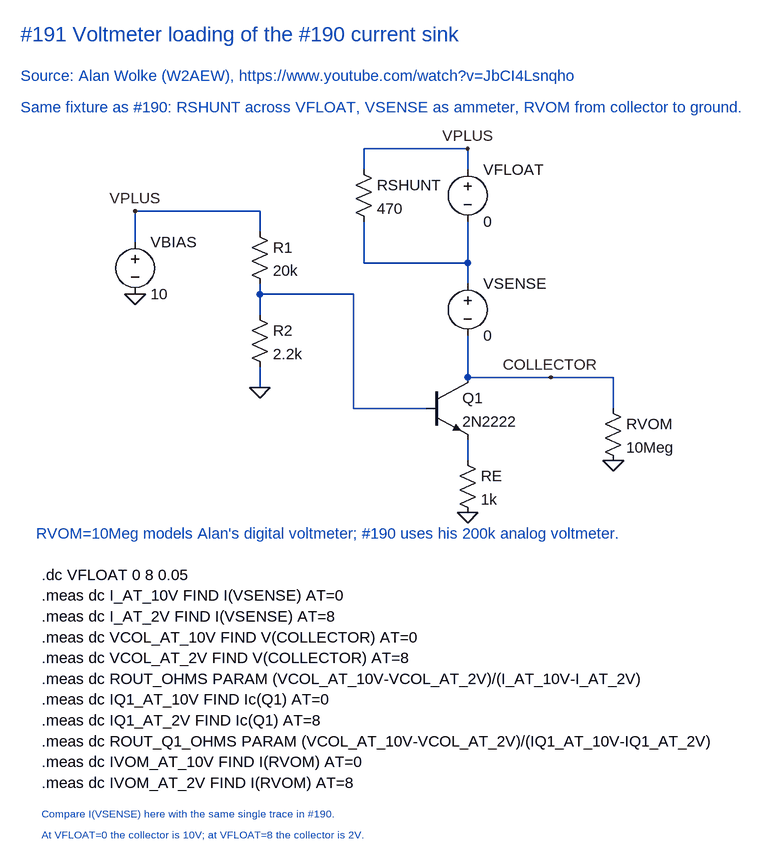
[diagram p0: schematic Current-source voltmeter loading.asc]
Current-source voltmeter loading.asc, the LTspice schematic file:
Version 4.1
SHEET 1 2208 1536
WIRE 736 -96 576 -96
WIRE 576 -64 576 -96
WIRE 736 -64 736 -96
WIRE 416 0 224 0
WIRE 416 32 416 0
WIRE 224 48 224 0
WIRE 576 80 576 16
WIRE 736 80 736 16
WIRE 736 80 576 80
WIRE 736 112 736 80
WIRE 416 128 416 112
WIRE 560 128 416 128
WIRE 416 160 416 128
WIRE 736 256 736 192
WIRE 864 256 736 256
WIRE 960 256 864 256
WIRE 416 272 416 240
WIRE 560 304 560 128
WIRE 672 304 560 304
WIRE 960 304 960 256
WIRE 736 384 736 352
FLAG 224 128 0
FLAG 416 272 0
FLAG 736 464 0
FLAG 960 384 0
FLAG 224 0 VPLUS
FLAG 736 -96 VPLUS
FLAG 864 256 COLLECTOR
SYMBOL voltage 224 32 R0
SYMATTR InstName VBIAS
SYMATTR Value 10
SYMBOL voltage 736 -80 R0
SYMATTR InstName VFLOAT
SYMATTR Value 0
SYMBOL res 400 16 R0
SYMATTR InstName R1
SYMATTR Value 20k
SYMBOL res 400 144 R0
SYMATTR InstName R2
SYMATTR Value 2.2k
SYMBOL res 560 -80 R0
SYMATTR InstName RSHUNT
SYMATTR Value 470
SYMBOL voltage 736 96 R0
SYMATTR InstName VSENSE
SYMATTR Value 0
SYMBOL npn 672 256 R0
SYMATTR InstName Q1
SYMATTR Value 2N2222
SYMBOL res 720 368 R0
SYMATTR InstName RE
SYMATTR Value 1k
SYMBOL res 944 288 R0
SYMATTR InstName RVOM
SYMATTR Value 10Meg
TEXT 48 -272 Left 3 ;#191 Voltmeter loading of the #190 current sink
TEXT 48 -208 Left 2 ;Source: Alan Wolke (W2AEW), https://www.youtube.com/watch?v=JbCI4Lsnqho
TEXT 48 -160 Left 2 ;Same fixture as #190: RSHUNT across VFLOAT, VSENSE as ammeter, RVOM from collector to ground.
TEXT 72 496 Left 2 ;RVOM=10Meg models Alan's digital voltmeter; #190 uses his 200k analog voltmeter.
TEXT 80 560 Left 2 !.dc VFLOAT 0 8 0.05
TEXT 80 592 Left 2 !.meas dc I_AT_10V FIND I(VSENSE) AT=0
TEXT 80 624 Left 2 !.meas dc I_AT_2V FIND I(VSENSE) AT=8
TEXT 80 656 Left 2 !.meas dc VCOL_AT_10V FIND V(COLLECTOR) AT=0
TEXT 80 688 Left 2 !.meas dc VCOL_AT_2V FIND V(COLLECTOR) AT=8
TEXT 80 720 Left 2 !.meas dc ROUT_OHMS PARAM (VCOL_AT_10V-VCOL_AT_2V)/(I_AT_10V-I_AT_2V)
TEXT 80 752 Left 2 !.meas dc IQ1_AT_10V FIND Ic(Q1) AT=0
TEXT 80 784 Left 2 !.meas dc IQ1_AT_2V FIND Ic(Q1) AT=8
TEXT 80 816 Left 2 !.meas dc ROUT_Q1_OHMS PARAM (VCOL_AT_10V-VCOL_AT_2V)/(IQ1_AT_10V-IQ1_AT_2V)
TEXT 80 848 Left 2 !.meas dc IVOM_AT_10V FIND I(RVOM) AT=0
TEXT 80 880 Left 2 !.meas dc IVOM_AT_2V FIND I(RVOM) AT=8
TEXT 80 928 Left 1 ;Compare I(VSENSE) here with the same single trace in #190.
TEXT 80 960 Left 1 ;At VFLOAT=0 the collector is 10V; at VFLOAT=8 the collector is 2V.

The netlist it stands for:
* Current-source voltmeter loading.asc
VBIAS VPLUS 0 10
VFLOAT VPLUS N001 0
R1 VPLUS N002 20k
R2 N002 0 2.2k
RSHUNT VPLUS N001 470
VSENSE N001 COLLECTOR 0
Q1 COLLECTOR N002 N003 0 2N2222
RE N003 0 1k
RVOM COLLECTOR 0 10Meg
.model NPN NPN
.model PNP PNP
.lib standard.bjt
* #191 Voltmeter loading of the #190 current sink
* Source: Alan Wolke (W2AEW), https://www.youtube.com/watch?v=JbCI4Lsnqho
* Same fixture as #190: RSHUNT across VFLOAT, VSENSE as ammeter, RVOM from collector to ground.
* RVOM=10Meg models Alan's digital voltmeter; #190 uses his 200k analog voltmeter.
.dc VFLOAT 0 8 0.05
.meas dc I_AT_10V FIND I(VSENSE) AT=0
.meas dc I_AT_2V FIND I(VSENSE) AT=8
.meas dc VCOL_AT_10V FIND V(COLLECTOR) AT=0
.meas dc VCOL_AT_2V FIND V(COLLECTOR) AT=8
.meas dc ROUT_OHMS PARAM (VCOL_AT_10V-VCOL_AT_2V)/(I_AT_10V-I_AT_2V)
.meas dc IQ1_AT_10V FIND Ic(Q1) AT=0
.meas dc IQ1_AT_2V FIND Ic(Q1) AT=8
.meas dc ROUT_Q1_OHMS PARAM (VCOL_AT_10V-VCOL_AT_2V)/(IQ1_AT_10V-IQ1_AT_2V)
.meas dc IVOM_AT_10V FIND I(RVOM) AT=0
.meas dc IVOM_AT_2V FIND I(RVOM) AT=8
* Compare I(VSENSE) here with the same single trace in #190.
* At VFLOAT=0 the collector is 10V; at VFLOAT=8 the collector is 2V.
.backanno
.end